# Altium project MD040EVM_RevA.PrjPCB (part 2 of 3)

## Sheet MD040_Motor_Driver_RevA.SchDoc
size 431 x 279 mm; Date: Not shown in title block; ApprovedBy: Not shown in title block; CheckedBy: Not shown in title block; Author: Not shown in title block; CompanyName: Not shown in title block; DrawnBy: ak; Engineer: Not shown in title block; Organization: Not shown in title block; Address1: Not shown in title block; Address2: Not shown in title block; Address3: Not shown in title block; Address4: Not shown in title block; DocumentNumber: 2; Revision: Use project parameter SCH_Rev; SheetNumber: 4; SheetTotal: 2; PageSetup: Record=PageOptions|CenterHorizontal=True|CenterVertical=True|PrintScale=1.00|XCorrection=1.00|YCorrection=1.00|PrintKind=0|BorderSize=5000000|LeftOffset=0|BottomOffset=0|Orientation=2|PaperLength=1000|PaperWidth=1000|Scale=100|PaperSource=15|PrintQuality=600|MediaType=1|DitherType=10|PaperKind=Letter|PrintScaleMode=1; CurrentTime: Not shown in title block; CurrentDate: Not shown in title block; Time: Not shown in title block; DocumentFullPathAndName: Not shown in title block; DocumentName: Not shown in title block; ModifiedDate: Not shown in title block; ImagePath: Not shown in title block
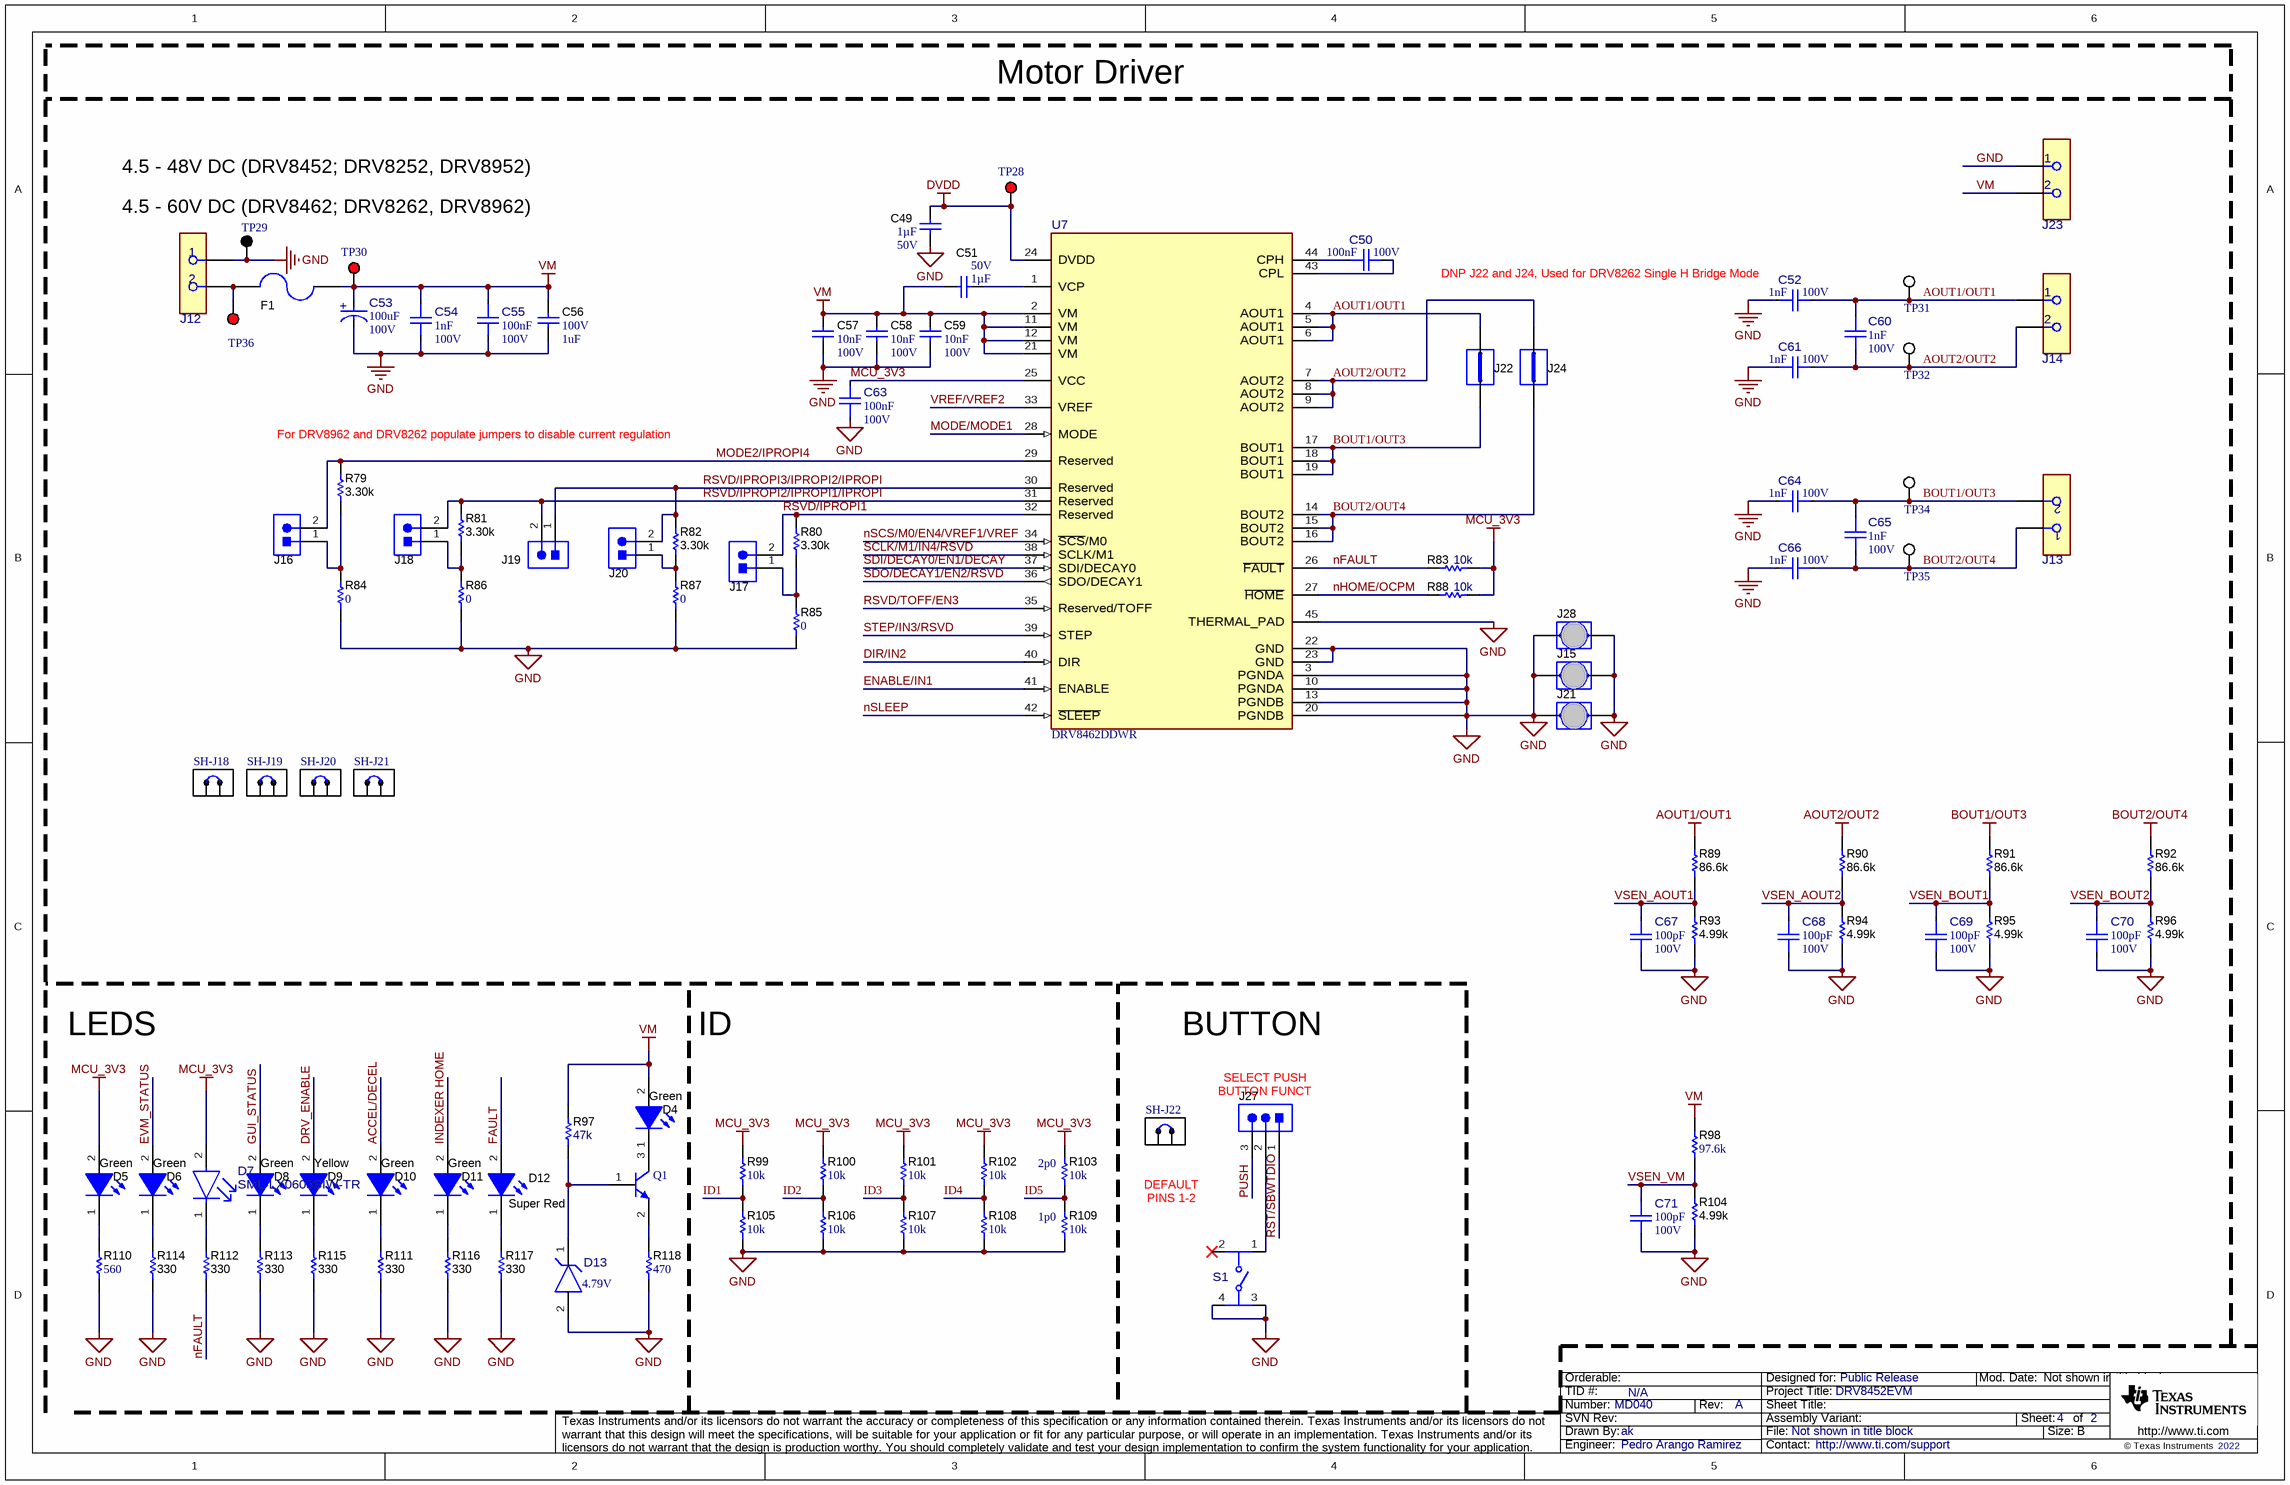
[diagram p1: MD040_Motor_Driver_RevA.SchDoc]

### Parts
C49  Cap_F: 1µF  VDC_V: 50V  [0805_HV]  (hidden comment: C2012X7R1H105K125AB)
C50  Cap_F: 100nF  VDC_V: 100V  [FP-885012206120_0603-MFG]  (hidden comment: 885012206120)
C51  Cap_F: 1µF  VDC_V: 50V  [0805_HV]  (hidden comment: C2012X7R1H105K125AB)
C52  ValueDisplayed: 1nF  VDC_V: 100V  [FP-885012006085_0603-MFG]  (hidden comment: 885012006085)
C53  ValueDisplayed: 100uF  VDC_V: 100V  [FP-EMVY101ARA101MKE0S_RADIAL-MFG]  (hidden comment: EMVY101ARA101MKE0S)
C54  ValueDisplayed: 1nF  VDC_V: 100V  [FP-885012006085_0603-MFG]  (hidden comment: 885012006085)
C55  Cap_F: 100nF  VDC_V: 100V  [FP-885012206120_0603-MFG]  (hidden comment: 885012206120)
C56  VDC_V: 100V  ValueDisplayed: 1uF  [1210_220]  (hidden comment: CGA6M2X7R2A105K200AA)
C57  Cap_F: 10nF  VDC_V: 100V  [0603L]  (hidden comment: 885012206114)
C58  Cap_F: 10nF  VDC_V: 100V  [0603L]  (hidden comment: 885012206114)
C59  Cap_F: 10nF  VDC_V: 100V  [0603L]  (hidden comment: 885012206114)
C60  ValueDisplayed: 1nF  VDC_V: 100V  [FP-885012006085_0603-MFG]  (hidden comment: 885012006085)
C61  ValueDisplayed: 1nF  VDC_V: 100V  [FP-885012006085_0603-MFG]  (hidden comment: 885012006085)
C63  Cap_F: 100nF  VDC_V: 100V  [FP-885012206120_0603-MFG]  (hidden comment: 885012206120)
C64  ValueDisplayed: 1nF  VDC_V: 100V  [FP-885012006085_0603-MFG]  (hidden comment: 885012006085)
C65  ValueDisplayed: 1nF  VDC_V: 100V  [FP-885012006085_0603-MFG]  (hidden comment: 885012006085)
C66  ValueDisplayed: 1nF  VDC_V: 100V  [FP-885012006085_0603-MFG]  (hidden comment: 885012006085)
C67  ValueDisplayed: 100pF  VDC_V: 100V  [FP-885012005080_0402-MFG]  (hidden comment: 885012005080)
C68  ValueDisplayed: 100pF  VDC_V: 100V  [FP-885012005080_0402-MFG]  (hidden comment: 885012005080)
C69  ValueDisplayed: 100pF  VDC_V: 100V  [FP-885012005080_0402-MFG]  (hidden comment: 885012005080)
C70  ValueDisplayed: 100pF  VDC_V: 100V  [FP-885012005080_0402-MFG]  (hidden comment: 885012005080)
C71  ValueDisplayed: 100pF  VDC_V: 100V  [FP-885012005080_0402-MFG]  (hidden comment: 885012005080)
D4  value Green  [WL-SMCW_GREEN]  (hidden comment: 150060VS75000)
D5  value Green  [WL-SMCW_GREEN]  (hidden comment: 150060VS75000)
D6  value Green  [WL-SMCW_GREEN]  (hidden comment: 150060VS75000)
D7  SML-LX0603SIW-TR  [FP-SML-LX0603SIW-TR_0603-MFG]
D8  value Green  [WL-SMCW_GREEN]  (hidden comment: 150060VS75000)
D9  value Yellow  [WL-SMCW_YELLOW]  (hidden comment: 150060YS75000)
D10  value Green  [WL-SMCW_GREEN]  (hidden comment: 150060VS75000)
D11  value Green  [WL-SMCW_GREEN]  (hidden comment: 150060VS75000)
D12  value Super Red  [WL-SMCW_RED]  (hidden comment: 150060SS75000)
D13  Vf_V: 4.79V  [FP-BZX84J-B4V7,115_SC90-MFG]  (hidden comment: BZX84J-B4V7,115)
F1  0463015.ER  [Fuse_0463]  (value not drawn)
J12  691256610002  [FP-691256610002_HDR2-MFG]  (value not drawn)
J13  691250610002  [FP-691250610002_CONN_TERM_BLOCK2-MFG]  (value not drawn)
J14  691250610002  [FP-691250610002_CONN_TERM_BLOCK2-MFG]  (value not drawn)
J15  D3082-05  [Harwin_D3082-05]  (value not drawn)
J16  PBC02SAAN  [Sullins_PBC02SAAN]  (value not drawn)
J17  PBC02SAAN  [Sullins_PBC02SAAN]  (value not drawn)
J18  PBC02SAAN  [Sullins_PBC02SAAN]  (value not drawn)
J19  PBC02SAAN  [Sullins_PBC02SAAN]  (value not drawn)
J20  PBC02SAAN  [Sullins_PBC02SAAN]  (value not drawn)
J21  D3082-05  [Harwin_D3082-05]  (value not drawn)
J22  D3082-05  [Harwin_D3082-05]  (value not drawn)
J23  691250610002  [FP-691250610002_CONN_TERM_BLOCK2-MFG]  (value not drawn)
J24  D3082-05  [Harwin_D3082-05]  (value not drawn)
J27  61300311121  [WURTH_61300311121]  (value not drawn)
J28  D3082-05  [Harwin_D3082-05]  (value not drawn)
Q1  BC846BLT1G  [ONSC-SOT-23-3-318-08_V]  (value not drawn)
R79  ValueDisplayed: 3.30k  [0402L]  (hidden comment: ERJ-2RKF3301X)
R80  ValueDisplayed: 3.30k  [0402L]  (hidden comment: ERJ-2RKF3301X)
R81  ValueDisplayed: 3.30k  [0402L]  (hidden comment: ERJ-2RKF3301X)
R82  ValueDisplayed: 3.30k  [0402L]  (hidden comment: ERJ-2RKF3301X)
R83  ValueDisplayed: 10k  [0603L]  (hidden comment: RC0603JR-0710KL)
R84  ValueDisplayed: 0  [0402]  (hidden comment: CRCW04020000Z0EDHP)
R85  ValueDisplayed: 0  [0402]  (hidden comment: CRCW04020000Z0EDHP)
R86  ValueDisplayed: 0  [0402]  (hidden comment: CRCW04020000Z0EDHP)
R87  ValueDisplayed: 0  [0402]  (hidden comment: CRCW04020000Z0EDHP)
R88  ValueDisplayed: 10k  [0603L]  (hidden comment: RC0603JR-0710KL)
R89  ValueDisplayed: 86.6k  [0603L]  (hidden comment: CRCW060386K6FKEA)
R90  ValueDisplayed: 86.6k  [0603L]  (hidden comment: CRCW060386K6FKEA)
R91  ValueDisplayed: 86.6k  [0603L]  (hidden comment: CRCW060386K6FKEA)
R92  ValueDisplayed: 86.6k  [0603L]  (hidden comment: CRCW060386K6FKEA)
R93  ValueDisplayed: 4.99k  [0603L]  (hidden comment: CRCW06034K99FKEA)
R94  ValueDisplayed: 4.99k  [0603L]  (hidden comment: CRCW06034K99FKEA)
R95  ValueDisplayed: 4.99k  [0603L]  (hidden comment: CRCW06034K99FKEA)
R96  ValueDisplayed: 4.99k  [0603L]  (hidden comment: CRCW06034K99FKEA)
R97  ValueDisplayed: 47k  [0402]  (hidden comment: CRCW040247K0JNED)
R98  ValueDisplayed: 97.6k  [0603]  (hidden comment: RT0603DRE0797K6L)
R99  ValueDisplayed: 10k  [0603L]  (hidden comment: RC0603JR-0710KL)
R100  ValueDisplayed: 10k  [0603L]  (hidden comment: RC0603JR-0710KL)
R101  ValueDisplayed: 10k  [0603L]  (hidden comment: RC0603JR-0710KL)
R102  ValueDisplayed: 10k  [0603L]  (hidden comment: RC0603JR-0710KL)
R103  ValueDisplayed: 10k  [0603L]  (hidden comment: RC0603JR-0710KL)
R104  ValueDisplayed: 4.99k  [0603L]  (hidden comment: CRCW06034K99FKEA)
R105  ValueDisplayed: 10k  [0603L]  (hidden comment: RC0603JR-0710KL)
R106  ValueDisplayed: 10k  [0603L]  (hidden comment: RC0603JR-0710KL)
R107  ValueDisplayed: 10k  [0603L]  (hidden comment: RC0603JR-0710KL)
R108  ValueDisplayed: 10k  [0603L]  (hidden comment: RC0603JR-0710KL)
R109  ValueDisplayed: 10k  [0603L]  (hidden comment: RC0603JR-0710KL)
R110  ValueDisplayed: 560  [0603]  (hidden comment: RC0603FR-07560RL)
R111  ValueDisplayed: 330  [0603L]  (hidden comment: CMP-0025785-4)
R112  ValueDisplayed: 330  [0603L]  (hidden comment: CMP-0025785-4)
R113  ValueDisplayed: 330  [0603L]  (hidden comment: CMP-0025785-4)
R114  ValueDisplayed: 330  [0603L]  (hidden comment: CMP-0025785-4)
R115  ValueDisplayed: 330  [0603L]  (hidden comment: CMP-0025785-4)
R116  ValueDisplayed: 330  [0603L]  (hidden comment: CMP-0025785-4)
R117  ValueDisplayed: 330  [0603L]  (hidden comment: CMP-0025785-4)
R118  ValueDisplayed: 470  [0603]  (hidden comment: RC0603FR-07470RL)
S1  430481025816  [FP-430481025816_SMT_SW_6MM2_6MM2-MFG]  (value not drawn)
SH-J18  60900213421  [Wurth_60900213421]  (value not drawn)
SH-J19  60900213421  [Wurth_60900213421]  (value not drawn)
SH-J20  60900213421  [Wurth_60900213421]  (value not drawn)
SH-J21  60900213421  [Wurth_60900213421]  (value not drawn)
SH-J22  60900213421  [Wurth_60900213421]  (value not drawn)
TP28  5010  [Keystone5010]  (value not drawn)
TP29  5011  [Keystone5011]  (value not drawn)
TP30  5010  [Keystone5010]  (value not drawn)
TP31  5015  [Testpoint_Keystone_Miniature]  (value not drawn)
TP32  5015  [Testpoint_Keystone_Miniature]  (value not drawn)
TP34  5015  [Testpoint_Keystone_Miniature]  (value not drawn)
TP35  5015  [Testpoint_Keystone_Miniature]  (value not drawn)
TP36  5010  [Keystone5010]  (value not drawn)
U7  DRV8462DDWR  [DDW0044E-MFG]

### Nets
AOUT1/OUT1: C52.2 C60.1 J14.1 J22.2 R89.2 TP31.1 U7.4(AOUT1) U7.5(AOUT1) U7.6(AOUT1)
AOUT2/OUT2: C60.2 C61.2 J14.2 J24.2 R90.2 TP32.1 U7.7(AOUT2) U7.8(AOUT2) U7.9(AOUT2)
BOUT1/OUT3: C64.2 C65.1 J13.2 J22.1 R91.2 TP34.1 U7.17(BOUT1) U7.18(BOUT1) U7.19(BOUT1)
BOUT2/OUT4: C65.2 C66.2 J13.1 J24.1 R92.2 TP35.1 U7.14(BOUT2) U7.15(BOUT2) U7.16(BOUT2)
DVDD: C49.1 TP28.1 U7.24(DVDD)
GND: C49.2 C52.1 C53.1(CATHODE) C54.2 C55.2 C56.2 C57.2 C58.2 C59.2 C61.1 C63.1 C64.1 C66.1 C67.2 C68.2 C69.2 C70.2 C71.2 D13.2(anode) J12.1 J15.1 J15.2 J21.1 J21.2 J23.1 J28.1 J28.2 R84.1 R85.1 R86.1 R87.1 R93.1 R94.1 R95.1 R96.1 R104.1 R105.2 R106.2 R107.2 R108.2 R109.2 R110.1 R111.1 R113.1 R114.1 R115.1 R116.1 R117.1 R118.1 S1.3 S1.4 TP29.1 U7.3(PGNDA) U7.10(PGNDA) U7.13(PGNDB) U7.20(PGNDB) U7.22(GND) U7.23(GND) U7.45(THERMAL_PAD)
MCU_3V3: C63.2 D5.2(A) D7.2(ANODE) R83.2 R88.2 R99.1 R100.1 R101.1 R102.1 R103.1 U7.25(VCC)
VM: C51.1 C53.2(ANODE) C54.1 C55.1 C56.1 C57.1 C58.1 C59.1 D4.2(A) F1.1 J23.2 R97.2 R98.2 TP30.1 U7.2(VM) U7.11(VM) U7.12(VM) U7.21(VM)
ACCEL/DECEL: D10.2(A)
DIR/IN2: U7.40(DIR)
DRV_ENABLE: D9.2(A)
ENABLE/IN1: U7.41(ENABLE)
EVM_STATUS: D6.2(A)
FAULT: D12.2(A)
GUI_STATUS: D8.2(A)
ID1: R99.2 R105.1
ID2: R100.2 R106.1
ID3: R101.2 R107.1
ID4: R102.2 R108.1
ID5: R103.2 R109.1
INDEXER HOME: D11.2(A)
MODE2/IPROPI4: J16.2 R79.2 U7.29(Reserved)
MODE/MODE1: U7.28(MODE)
nFAULT: R83.1 R112.1 U7.26(~{FAULT})
nHOME/OCPM: R88.1 U7.27(~{HOME})
nSCS/M0/EN4/VREF1/VREF: U7.34(~{SCS}/M0)
nSLEEP: U7.42(~{SLEEP})
PUSH: J27.3
RST/SBWTDIO: J27.1
RSVD/IPROPI1: J17.2 R80.2 U7.32(Reserved)
RSVD/IPROPI2/IPROPI1/IPROPI: J18.2 J19.2 R81.2 U7.31(Reserved)
RSVD/IPROPI3/IPROPI2/IPROPI: J19.1 J20.2 R82.2 U7.30(Reserved)
RSVD/TOFF/EN3: U7.35(Reserved/TOFF)
SCLK/M1/IN4/RSVD: U7.38(SCLK/M1)
SDI/DECAY0/EN1/DECAY: U7.37(SDI/DECAY0)
SDO/DECAY1/EN2/RSVD: U7.36(SDO/DECAY1)
STEP/IN3/RSVD: U7.39(STEP)
VREF/VREF2: U7.33(VREF)
VSEN_AOUT1: C67.1 R89.1 R93.2
VSEN_AOUT2: C68.1 R90.1 R94.2
VSEN_BOUT1: C69.1 R91.1 R95.2
VSEN_BOUT2: C70.1 R92.1 R96.2
VSEN_VM: C71.1 R98.1 R104.2
NetC50_1: C50.1 U7.44(CPH)
NetC50_2: C50.2 U7.43(CPL)
NetC51_2: C51.2 U7.1(VCP)
NetD5_1: D5.1(K) R110.2
NetD6_1: D6.1(K) R114.2
NetD7_1: D7.1(CATHODE) R112.2
NetD8_1: D8.1(K) R113.2
NetD9_1: D9.1(K) R115.2
NetD10_1: D10.1(K) R111.2
NetD11_1: D11.1(K) R116.2
NetD12_1: D12.1(K) R117.2
NetD13_1: D13.1(cathode) Q1.1(B) R97.1
NetF1_2: F1.2 J12.2 TP36.1
NetJ16_1: J16.1 R79.1 R84.2
NetJ17_1: J17.1 R80.1 R85.2
NetJ18_1: J18.1 R81.1 R86.2
NetJ20_1: J20.1 R82.1 R87.2
NetJ27_2: J27.2 S1.1
NetQ1_2: Q1.2(E) R118.2

Not connected (* = marked no-connect by the designer): D4 1(K); Q1 3(C); S1 2*

### Notes on the sheet
- Motor Driver
- 4.5 - 48V DC (DRV8452; DRV8252, DRV8952)
- 4.5 - 60V DC (DRV8462; DRV8262, DRV8962)
- (near C52) DNP J22 and J24, Used for DRV8262 Single H Bridge Mode
- (near R79) For DRV8962 and DRV8262 populate jumpers to disable current regulation
- LEDS
- ID
- BUTTON
- (near J27) SELECT PUSH
- (near J27) BUTTON FUNCT
- (near R103) 2p0
- (near R109) 1p0
- (near SH-J22) DEFAULT
- PINS 1-2
- Drawn By:
- SVN Rev:
- Number:
- TID #:
- Orderable:
- Rev:
- Sheet Title:
- File:
- Project Title:
- Designed for:
- Assembly Variant:
- Mod. Date:
- Sheet:
- Size:
- of
- B
- http://www.ti.com
- Texas Instruments and/or its licensors do not warrant the accuracy or completeness of this specification or any information contained therein. Texas Instruments and/or its licensors do not warrant that this design will meet the specifications, will be suitable for your application or fit for any particular purpose, or will operate in an implementation. Texas Instruments and/or its licensors do not warrant that the design is production worthy. You should completely validate and test your design implementation to confirm the system functionality for your application.
- Engineer:
- Contact:
- © Texas Instruments
- (in symbol CMP-0094051-1) +

### Library data of the parts
C49 C51 = CMP-0007873-2: CAP, CERM, 1 uF, 50 V, +/- 10%, X7R, 0805; Manufacturer: TDK; TaMin_C: -55°C; ESR_ohm: 8.782m; Polarized: N; SizeAreaWB_mm2: 6.75; Value1: 0.008782 ohm; U/M: EA; Value: 1uF; TaMax_C: 125°C; SizeZ_mm: 1.45; SizeX_mm: 2; SizeY_mm: 1.25; Cap_Case: 0805; SizeArea_mm2: 2.5; IRMS_A: 2.2049A; AEC Category: Q200; Supplier Part Number 2: 810-C2012X7R1H105K; Publisher: Texas Instruments; Supplier 2: Mouser; TempCo: X7R; Published: 2008-06-19; RoHS: Y; MountType: SMT; Supplier 1: Digi-Key; PackageReference: 0805; Tolerance_%: 10%; Value2: 50V; CompType: Capacitor; LatestRevisionDate: 2017-03-09; PartNumber: C2012X7R1H105K125AB; AEC Qualified: N; ComponentLink1Description: Datasheet link; AEC Grade: N/A; Supplier Part Number 1: 445-7547-1-ND; Technology: Ceramic; ValueDisplayed: 1uF; ComponentLink1URL: https://product.tdk.com/en/search/capacitor/ceramic/mlcc/info?part_no=C2012X7R1H105K125AB
C50 C55 C63 = CMP-0095152-1: 0.1 µF ±10% 100V Ceramic Capacitor X7R 0603 (1608 Metric); Manufacturer: Wurth Electronics; Value: 100nF; SizeZ_mm: 0.87mm; AEC Qualified: No; TempCo: 15%; Supplier 1: Digikey; Mouser Part Number: 710-885012206120; PartNumber: 885012206120; ValueDisplayed: 100nF; ComponentLink1Description: Datasheet; Digikey Part Number: 732-885012206120TR-ND; Supplier 2: Mouser; PackageReference: 0603; Datasheet Path: datasheets/Cap-885012206120.pdf; ComponentLink1URL: https://www.we-online.com/catalog/datasheet/885012206120.pdf; Supplier Part Number 2: 710-885012206120; Supplier Part Number 1: 732-885012206120TR-ND; Part Number: 885012206120; Tolerance_%: 10%; helpURL: https://upverter.com/upn/revision/38ac6779d2d2789e/; Lead Free: Yes; RoHS: TRUE; Temperature Characteristic: X7R; datasheet: https://www.we-online.com/catalog/datasheet/885012206120.pdf; Digikey Description: WCAP-CSGP GENERAL PURPOSE MLCC X; Operating Temperature Range: -55°C to +125°C
C52 C54 C60 C61 C64-C66 = CMP-0097311-1: 1000 pF ±5% 100V Ceramic Capacitor C0G, NP0 0603 (1608 Metric); Manufacturer: Wurth Electronics; TempCo: 30ppm/°C; SizeZ_mm: 0.87mm; AEC Qualified: No; Value: 1nF; ComponentLink1URL: https://www.we-online.com/katalog/datasheet/885012006085.pdf; Temperature Characteristic: NP0; RoHS: TRUE; Part Number: 885012006085; Cap_F: 1nF; Mouser Description: Cap, 1000PF, 100V, 5%, C0G/NP0, 0603; Digikey Part Number: 732-12187-1-ND; Datasheet Path: datasheets/Cap-885012006085.pdf; Digikey Description: CAP CER 1000PF 100V C0G/NP0 0603; PackageReference: 0603; Mouser Part Number: 710-885012006085; Supplier Part Number 2: 710-885012006085; PartNumber: 885012006085; Supplier 1: Digikey; Lead Free: Yes; datasheet: https://www.we-online.com/katalog/datasheet/885012006085.pdf; Supplier 2: Mouser; helpURL: https://upverter.com/upn/revision/edb0b292dcaf6ba6/; Operating Temperature Range: -55°C to +125°C; ComponentLink1Description: Datasheet; Tolerance_%: 5%; Supplier Part Number 1: 732-12187-1-ND
C53 = CMP-0094051-1: 100uF 100V 20% Aluminum Electrolytic Capacitors Radial, Can - SMD - 5000 Hrs @ 105°C; Manufacturer: United Chemi-Con; Value: 100µF; IRMS_A: 450mA; Life: 5000Hours; SizeZ_mm: 14mm; AEC Grade: Grade 2; Leakage Current: 100uA; Dissipation Factor: 10%; AEC Qualified: Yes; Tolerance_%: 20%; Supplier 1: Digikey; helpURL: https://upverter.com/upn/revision/452647827c621875/; Lead Free: Yes; Part Number: EMVY101ARA101MKE0S; Supplier Part Number 1: 565-2511-1-ND; PartNumber: EMVY101ARA101MKE0S; Cap_F: 100µF; ComponentLink1Description: Datasheet; Digikey Part Number: 565-2511-1-ND; Datasheet Path: datasheets/Cap-EMVY101ARA101MKE0S.pdf; RoHS: TRUE; Mouser Description: Cap Aluminum Lytic 100uF 100V 20% (12.5 X 13.5mm) SMD 450mA 5000h 105C Automotive T/R; ComponentLink1URL: https://www.chemi-con.co.jp/products/relatedfiles/capacitor/catalog/MVYRA-e.PDF; Operating Temperature Range: -40°C to +105°C; PackageReference: RADIAL; datasheet: https://www.chemi-con.co.jp/products/relatedfiles/capacitor/catalog/MVYRA-e.PDF; Digikey Description: CAP ALUM 100UF 20% 100V SMD; Mouser Part Number: 661-EMVY101ARA101MKE; Supplier Part Number 2: 661-EMVY101ARA101MKE; Supplier 2: Mouser
C56 = CMP-0009145-2: CAP, CERM, 1 uF, 100 V, +/- 10%, X7R, AEC-Q200 Grade 1, 1210; Manufacturer: TDK; TaMin_C: -55°C; ESR_ohm: 4.956m; Polarized: N; SizeAreaWB_mm2: 14.7; Value1: 0.004956 ohm; U/M: EA; Value: 1uF; TaMax_C: 125°C; SizeZ_mm: 2.2; SizeX_mm: 3.2; SizeY_mm: 2.5; SizeArea_mm2: 8; AEC Qualified: Y; Cap_F: 1µF; IRMS_A: 3.30731A; AEC Grade: 1; AEC Category: Q200; Supplier Part Number 2: 810-CGA6M2X7R2A105K200AA; Publisher: Texas Instruments; Supplier 2: Mouser; TempCo: X7R; Published: 2008-06-19; RoHS: Y; MountType: SMT; Supplier 1: Digi-Key; PackageReference: 1210; Tolerance_%: 10%; Cap_Case: 1210_220; Value2: 100V; CompType: Capacitor; LatestRevisionDate: 2017-03-09; PartNumber: CGA6M2X7R2A105K200AA; ComponentLink1Description: Datasheet link; Supplier Part Number 1: 445-5865-1-ND; Technology: Ceramic; ComponentLink1URL: https://product.tdk.com/en/search/capacitor/ceramic/mlcc/info?part_no=CGA6M2X7R2A105K200AA
C57-C59 = CMP-0079993-1: CAP, CERM, 0.01 µF, 100 V,+/- 10%, X7R, 0603; Manufacturer: Wurth Elektronik; Polarized: N; Value: 0.01uF; ValueDisplayed: 0.01µF; U/M: EA; TaMin_C: -55°C; TaMax_C: 105°C; Cap_Case: 0603; SizeX_mm: 1.6; SizeArea_mm2: 1.28; AEC Category: Q200; SizeZ_mm: 1; SizeAreaWB_mm2: 4.68; SizeY_mm: 0.8; CompType: Capacitor; PartNumber: 885012206114; PackageReference: 0603; RoHS: Y; Tolerance_%: 10%; Value2: 100V; MountType: SMT; Technology: Ceramic; TempCo: X7R; ComponentLink1Description: Datasheet link; ComponentLink1URL: http://katalog.we-online.de/pbs/datasheet/885012206114.pdf; Supplier 1: Newark; Supplier Part Number 1: 45AC8565; Supplier 2: Farnell; Supplier Part Number 2: 2812368; AEC Qualified: N; AEC Grade: N/A
C67-C71 = CMP-0097308-1: 100 pF ±5% 100V Ceramic Capacitor C0G, NP0 0402 (1005 Metric); Manufacturer: Wurth Electronics; Value: 100pF; SizeZ_mm: 0.55mm; TempCo: 30ppm/°C; AEC Qualified: No; Digikey Part Number: 732-12055-1-ND; Mouser Part Number: 710-885012005080; datasheet: https://www.we-online.com/catalog/datasheet/885012005080.pdf; Supplier 2: Mouser; Cap_F: 100pF; Mouser Description: Cap, 100PF, 100V, 5%, C0G/NP0, 0402; Datasheet Path: datasheets/Cap-885012005080.pdf; Supplier 1: Digikey; helpURL: https://upverter.com/upn/revision/ec0fd02776fae1b6/; Lead Free: Yes; PackageReference: 0402; RoHS: TRUE; Tolerance_%: 5%; Temperature Characteristic: NP0; Supplier Part Number 2: 710-885012005080; PartNumber: 885012005080; ComponentLink1URL: https://www.we-online.com/catalog/datasheet/885012005080.pdf; Part Number: 885012005080; Supplier Part Number 1: 732-12055-1-ND; Digikey Description: CAP CER 100PF 100V C0G/NP0 0402; ComponentLink1Description: Datasheet; Operating Temperature Range: -55°C to +125°C
D4-D6 D8 D10 D11 = CMP-0002894-2: LED, Green, SMD; Manufacturer: Wurth Elektronik; Type: AlInGaP; Value2: 2V; Io_A: 20mA; Value1: W; PartNumber: 150060VS75000; PackageReference: LED_0603; ComponentLink1Description: Datasheet link; ComponentLink1URL: http://katalog.we-online.de/led/datasheet/150060VS75000.pdf; Color: green; RoHS: Y; MountType: SMT; CompType: LED; Vf_V: 2V
D7 = CMP-0092971-1: Red - LED Indication - Discrete 2V 0603 (1608 Metric) 2V @ 20mA 71.5mcd 48mW; Manufacturer: Lumex; Led Orientation: Top View; Vr_V: 5V; LambdaP: 632nm; AEC Qualified: No; Angle: 128°; SizeZ_mm: 0.727mm; Digikey Description: LED RED DIFFUSED SMD; ComponentLink1Description: Datasheet; Vf_V: 2V; ComponentLink1URL: https://www.lumex.com/datasheet/SML-LX0603SIW-TR; Operating Temperature Range: -40°C to +85°C; PackageReference: 0603; helpURL: https://upverter.com/upn/revision/94e7ffcf0c58ff44/; Power_TotalModule: 48mW; RoHS: TRUE; Mouser Part Number: 696-SML-LX0603SIW; Lead Free: Yes; Luminous Intensity: 71.5mcd; Forward Current: 20mA; datasheet: https://www.lumex.com/datasheet/SML-LX0603SIW-TR; Color: Red; PartNumber: SML-LX0603SIW-TR; Datasheet Path: datasheets/Diode-SML-LX0603SIW-TR.pdf; Mouser Description: Standard LEDs - SMD Hi-Int Red, 636nm 2V, 60mcd; Part Number: SML-LX0603SIW-TR; Digikey Part Number: 67-1690-1-ND
D9 = CMP-0002892-3: LED, Yellow, SMD; Manufacturer: Wurth Elektronik; Value1: W; Vf_V: 2V; Type: AlInGaP; Io_A: 20mA; PartNumber: 150060YS75000; PackageReference: LED_0603; ComponentLink1Description: Datasheet link; ComponentLink1URL: http://katalog.we-online.de/led/datasheet/150060YS75000.pdf; Color: yellow; MountType: SMT; Value2: 2V; CompType: LED; RoHS: Y
D12 = CMP-0002893-1: LED, Super Red, SMD; Manufacturer: Wurth Elektronik; Io_A: 20mA; Value1: W; U/M: EA; Vf_V: 1.9V; Type: AlInGaP; ComponentLink1URL: http://katalog.we-online.de/led/datasheet/150060SS75000.pdf; Supplier Part Number 2: 95W3796; Publisher: Texas Instruments; Supplier 2: Newark; Supplier Part Number 3: 2322072; Color: super red; Supplier 3: Farnell; Published: 2008-07-11; RoHS: Y; MountType: SMT; Supplier 1: Digi-Key; PackageReference: LED_0603; Value2: 1.9V; CompType: LED; LatestRevisionDate: 2017-03-09; PartNumber: 150060SS75000; ComponentLink1Description: Datasheet link; Supplier Part Number 1: 732-4979-1-ND
D13 = CMP-0097377-1: Diode Zener Single 4.7V 2% 550mW Automotive 2-Pin SOD-323F T/R; Manufacturer: Nexperia; TaMin_C: -55°C; Vr_V: 2V; SizeZ_mm: 0.8mm; Max Reverse Leakage Current: 3uA; TJmax_C: 150°C; Zener Impedance: 80Ω; AEC Grade: Grade 0; Forward Current: 250mA; TaMax_C: +150°C; AEC Qualified: Yes; helpURL: https://upverter.com/upn/revision/e38fd3c12c5fddfe/; RoHS: TRUE; Lead Free: Yes; Vz_V: 4.7V; PackageReference: SC90; ComponentLink1URL: https://assets.nexperia.com/documents/data-sheet/BZX84J_SER.pdf; ComponentLink1Description: Datasheet; Digikey Description: DIODE ZENER 4.7V 550MW SOD323F; Operating Temperature Range: to +150°C; Power_W: 550mW; datasheet: https://assets.nexperia.com/documents/data-sheet/BZX84J_SER.pdf; Mouser Part Number: 771-BZX84J-B4V7,115; PartNumber: BZX84J-B4V7,115; Part Number: BZX84J-B4V7,115; Digikey Part Number: 1727-1672-1-ND; Datasheet Path: datasheets/Diode-BZX84J-B4V7,115.pdf
F1 = CMP-0081016-1: Fuse, 15 A, 250 VAC, 100 VDC, SMD; Manufacturer: Littelfuse; TaMin_C: -55°C; Irating_A: 15A; SizeAreaWB_mm2: 61.952; Interrupt_AC: 100A; Interrupt_DC: 50A; VAC_V: 250V; TaMax_C: 125°C; Fuse Speed: Fast; SizeZ_mm: 3.12; SizeX_mm: 10.1; SizeArea_mm2: 31.512; VDC_V: 100V; Fuse Technology: Board Mount; Rtyp_Ohm: 4.7m; MeltingTyp: 142; ComponentLink1URL: http://www.littelfuse.com/~/media/electronics/datasheets/fuses/littelfuse_fuse_463_datasheet.pdf.pdf; RoHS: Y; MountType: SMT; PackageReference: 10.1x3.12mm; SizeY_mm: 3.12; CompType: Fuse; PartNumber: 0463015.ER; ComponentLink1Description: Datasheet URL
J12 = CMP-0086764-1: 2 Position Wire to Board Terminal Block Horizontal with Board 0.400" (10.16mm) Through Hole.  58A max.; Manufacturer: Wurth; Current_A: 57A; Voltage_V: 750V; ContactFinish: Zinc; Row_Count: 1; PackageReference: HDR2; PinCount: 2; ComponentLink1Description: Datasheet; PartNumber: 691256610002; RoHS: TRUE; Symbol Name: SYM-691256610002; ComponentLink1URL: https://katalog.we-online.de/em/datasheet/691256610002.pdf
J13 J14 J23 = CMP-0093233-2: 2 Position Wire to Board Terminal Block Horizontal with Board 0.250" (6.35mm) Through Hole; Manufacturer: Wurth Electronics; Current_A: 32A; Conn Gender: Female; Row_Count: 1; ContactFinish: Zinc; SizeZ_mm: 21.6mm; Max Wire Gauge: 10; Min Wire Gauge: 30; Voltage_V: 450V; AEC Qualified: No; Is Female: yes; ComponentLink1Description: Datasheet; Supplier Part Number 1: 732-691250610002-ND; PartNumber: 691250610002; Mouser Part Number: 710-691250610002; Digikey Description: 6.35 MM TERMINAL BLOCK, HORIZONT; Conn Orientation: Horizontal; datasheet: https://www.we-online.com/catalog/datasheet/691250610002.pdf; Operating Temperature Range: -32°C to +120°C; Supplier 2: Mouser; Part Number: 691250610002; DUT-Pitch_mm: 6.35mm; helpURL: https://upverter.com/upn/revision/d28b3e63272a3f4f/; ComponentLink1URL: https://www.we-online.com/catalog/datasheet/691250610002.pdf; Supplier Part Number 2: 710-691250610002; Lead Free: Yes; Datasheet Path: datasheets/Conn-691250610002.pdf; Supplier 1: Digikey; RoHS: TRUE; PinCount: 2; PackageReference: CONN_TERM_BLOCK2; Digikey Part Number: 732-691250610002-ND
J15 J21 J22 J24 J28 = CMP-0075110-1: 1mm Uninsulated Shorting Plug, 10.16mm spacing, TH; Manufacturer: Harwin; CNHeader: False; Green_Lifecycle: Active; Green_REACh: Passed; CompType: Jumper Wire; ComponentLink1URL: http://cdn.harwin.com/pdfs/D3080-D3083.pdf; Supplier Part Number 2: 01E9240; Publisher: Texas Instruments; Supplier 2: Newark; Supplier Part Number 3: 855-D3082-05; Supplier 3: Mouser; RoHS: Y; MountType: TH; Green_EU RoHS-2: Passed; Supplier 1: Digi-Key; Green_EU RoHS: Passed with Exemption; PackageReference: Shorting Plug, 10.16mm spacing, TH; LatestRevisionDate: 2017-07-12; PartNumber: D3082-05; ComponentLink1Description: Datasheet URL; Supplier Part Number 1: 952-1873-ND; CT: False
J16-J20 = CMP-0054566-1: Header, 100mil, 2x1, Gold, TH; Manufacturer: Sullins Connector Solutions; CNHeader: TRUE; Current_A: 3A; Green_Lifecycle: Active; Shrouded: N; Gender: Male; Green_REACh: Passed; Voltage_V: 1.8kV; Row_Count: 1; Pitch_mm: 2.54; CT: FALSE; Cert_UL: Y; ComponentLink1URL: http://www.sullinscorp.com/catalogs/77_PAGE108-109_.100_MALE_HDR.pdf; ClassName: Header; Publisher: Texas Instruments; Color: Black; RoHS: Y; MountType: TH; Green_EU RoHS-2: Passed; Supplier 1: Digi-Key; Green_EU RoHS: Passed; PackageReference: Sullins 100mil, 1x2, 230 mil above insulator; PinCount: 2; CompType: Header; LatestRevisionDate: 26/05/2017; PartNumber: PBC02SAAN; Orientation: Vertical; ComponentLink1Description: Datasheet URL; Supplier Part Number 1: S1011E-02-ND; ContactFinish: Gold
J27 = CMP-0054796-4: Header, 2.54 mm, 3x1, Gold, TH; Manufacturer: Wurth Elektronics; Green_Lifecycle: Active; Green_REACh: Passed; CT: FALSE; CNHeader: TRUE; MountType: TH; Supplier Part Number 1: 732-5316-ND; ClassName: Header; Supplier Part Number 3: 356154; ComponentLink1Description: Datasheet URL; ComponentLink1URL: http://katalog.we-online.de/em/datasheet/6130xx11121.pdf; PackageReference: Header, 2.54mm, 3x1, TH; Supplier Part Number 2: 20X0950; Green_EU RoHS-2: Incomplete; CompType: Header; Green_EU RoHS: Passed; RoHS: Y; PartNumber: 61300311121; Supplier 2: Newark; Supplier 1: Digi-Key; Supplier 3: Farnell; Publisher: Texas Instruments; LatestRevisionDate: 26/05/2017
Q1 = CMP-1048-00779-1: General Purpose Transistor, NPN Silicon, 3-Pin SOT-23, Pb-Free, Tape and Reel; Manufacturer: On Semiconductor; fT Min (MHz): 100; IC Continuous (A): 0.1; Mounting Technology: Surface Mount; ComponentLink1Description: Manufacturer URL; ComponentLink2Description: Datasheet; Polarity: NPN; ComponentLink3URL: http://www.onsemi.cn/pub_link/Collateral/318-08.PDF; DatasheetVersion: Rev. 11; ComponentLink3Description: Package Specification; PartNumber: BC846BLT1G; RoHS: TRUE; PackageDescription: 3-Pin Small Outline Transistor, Body 2.92 x 1.3 mm, Pitch 0.95 mm; PackageReference: SOT-23-3-318-08; ComponentLink2URL: http://www.onsemi.cn/pub_link/Collateral/BC846ALT1-D.PDF; PackageVersion: Rev. AP, 11/2009; ComponentLink1URL: http://www.onsemi.com/; Packing: Tape and Reel
R79-R82 = CMP-0026695-1: RES, 3.30 k, 1%, 0.1 W, AEC-Q200 Grade 0, 0402; Manufacturer: Panasonic; Power_W: 100mW; TempCo: 100 ppm/C; Value_Code: 3k30; U/M: EA; Value: 3.30k; Res_ohm: 3.3k; SizeX_mm: 1; SizeY_mm: 0.5; SizeZ_mm: 0.6; Value2: 0.1W; AEC Qualified: Y; VDC_V: 50V; AEC Grade: 0; AEC Category: Q200; ComponentLink1URL: http://industrial.panasonic.com/cdbs/www-data/pdf/RDA0000/AOA0000C86.pdf; Supplier Part Number 2: 64R5278; Publisher: Texas Instruments; Supplier 2: Newark; Supplier Part Number 3: 667-ERJ-2RKF3301X; Supplier 3: Mouser; Published: 2008-06-26; RoHS: Y; Value1: 1%; MountType: SMT; Supplier 1: Digi-Key; PackageReference: 0402; Tolerance_%: 1%; SizeArea_mm2: 0.5; CompType: Resistor; LatestRevisionDate: 2017-03-09; PartNumber: ERJ-2RKF3301X; ComponentLink1Description: Datasheet link; Supplier Part Number 1: P3.30KLCT-ND; Technology: Thick Film
R83 R88 = CMP-0025886-3: RES, 10 k, 5%, 0.1 W, 0603; Manufacturer: Yageo America; Power_W: 100mW; TempCo: 100 ppm/C; Value_Code: 10k0; U/M: EA; Value: 10k; EIA_Code: E24; SizeX_mm: 1.6; SizeY_mm: 0.8; SizeZ_mm: 1; Value2: 0.1W; SizeArea_mm2: 1.28; VDC_V: 50V; AEC Category: Q200; Supplier Part Number 2: 603-RC0603JR-0710KL; Publisher: Texas Instruments; Supplier 2: Mouser; Supplier Part Number 3: 9233504; Supplier 3: Farnell; Published: 2008-06-26; RoHS: Y; Value1: 5%; MountType: SMT; Supplier 1: Digi-Key; PackageReference: 0603; Tolerance_%: 5%; Res_ohm: 10k; CompType: Resistor; LatestRevisionDate: 2017-03-09; PartNumber: RC0603JR-0710KL; AEC Qualified: ?; ComponentLink1Description: Datasheet link; Supplier Part Number 1: 311-10KGRCT-ND; Technology: Thick Film; ComponentLink1URL: http://www.yageo.com/pdf/Pu-RC0603_51_PbFree_L_2.pdf
R84-R87 = CMP-0081856-1: RES, 0, 0%, 0.2 W, AEC-Q200 Grade 0, 0402; Manufacturer: Vishay-Dale; SizeAreaWB_mm2: 3; SizeArea_mm2: 0.5; AEC Qualified: Y; AEC Category: Q200; Value: 0; SizeZ_mm: 0.6; Power_W: 200mW; VDC_V: 50V; Value2: 0.2W; SizeX_mm: 1; ComponentLink1Description: Datasheet link; RoHS: Y; Supplier Part Number 3: 71-CRCW04020000Z0EDH; Tolerance_%: 0%; Value_Code: 0; Supplier 1: Digi-Key; PackageReference: 0402; Technology: Thick Film; Res_ohm: 0; PartNumber: CRCW04020000Z0EDHP; Supplier Part Number 2: 96Y9050; Supplier 2: Newark; AEC Grade: 0; SizeY_mm: 0.5; ComponentLink1URL: http://www.vishay.com/docs/20043/crcwhpe3.pdf; Value1: 0%; CompType: Resistor; MountType: SMT; Supplier Part Number 1: 541-0.0YBTR-ND; Supplier 3: Mouser
R89-R92 = CMP-0022628-3: RES, 86.6 k, 1%, 0.1 W, 0603; Manufacturer: Vishay-Dale; Value: 86.6k; Value_Code: 86k6; Power_W: 100mW; Value2: 0.1W; VDC_V: 75V; TempCo: 100 ppm/C; EIA_Code: E96; U/M: EA; AEC Category: Q200; SizeY_mm: 0.8; SizeZ_mm: 1; SizeArea_mm2: 1.28; SizeX_mm: 1.6; CompType: Resistor; PartNumber: CRCW060386K6FKEA; PackageReference: 0603; RoHS: Y; Res_ohm: 86.6k; Tolerance_%: 1%; Value1: 1%; MountType: SMT; Technology: Thick Film; Published: 2008-06-26; Publisher: Texas Instruments; LatestRevisionDate: 2017-03-09; ComponentLink1Description: Datasheet link; ComponentLink1URL: http://www.vishay.com/docs/20035/dcrcwe3.pdf; Supplier 1: Digi-Key; Supplier Part Number 1: 541-86.6KHCT-ND; Supplier 2: Newark; Supplier Part Number 2: 52K8751; Supplier 3: Mouser; Supplier Part Number 3: 71-CRCW0603-86.6K-E3; AEC Qualified: ?
R93-R96 R104 = CMP-0022458-4: RES, 4.99 k, 1%, 0.1 W, AEC-Q200 Grade 0, 0603; Manufacturer: Vishay-Dale; Value: 4.99k; Value_Code: 4k99; Power_W: 100mW; Value2: 0.1W; VDC_V: 75V; TempCo: 100 ppm/C; EIA_Code: E96; SizeX_mm: 1.6; SizeY_mm: 0.8; SizeZ_mm: 1; SizeArea_mm2: 1.28; AEC Qualified: Y; AEC Category: Q200; AEC Grade: 0; CompType: Resistor; PartNumber: CRCW06034K99FKEA; PackageReference: 0603; RoHS: E; Res_ohm: 4.99k; Tolerance_%: 1%; Value1: 1%; MountType: SMT; Technology: Thick Film; ComponentLink1Description: Datasheet link; ComponentLink1URL: http://www.vishay.com/docs/20035/dcrcwe3.pdf; Supplier 1: Digi-Key; Supplier Part Number 1: 541-4.99KHCT-ND; Supplier 2: Newark; Supplier Part Number 2: 52K8500; Supplier 3: Mouser; Supplier Part Number 3: 71-CRCW0603-4.99K-E3
R97 = CMP-0026935-3: RES, 47 k, 5%, 0.063 W, AEC-Q200 Grade 0, 0402; Manufacturer: Vishay-Dale; Power_W: 63mW; TempCo: 200 ppm/C; Value_Code: 47k0; Value: 47k; EIA_Code: E24; SizeX_mm: 1; SizeY_mm: 0.5; SizeZ_mm: 0.6; Value2: 0.063W; AEC Qualified: Y; VDC_V: 50V; AEC Category: Q200; AEC Grade: 0; Supplier Part Number 2: 52K7099; Supplier 2: Newark; Supplier Part Number 3: 71-CRCW0402-J-47K-E3; Supplier 3: Mouser; RoHS: E; Value1: 5%; MountType: SMT; Supplier 1: Digi-Key; PackageReference: 0402; Tolerance_%: 5%; Res_ohm: 47k; SizeArea_mm2: 0.5; CompType: Resistor; PartNumber: CRCW040247K0JNED; ComponentLink1Description: Datasheet link; Supplier Part Number 1: 541-47KJCT-ND; Technology: Thick Film; ComponentLink1URL: http://www.vishay.com/docs/20035/dcrcwe3.pdf
R98 = CMP-0025663-3: RES, 97.6 k, 0.5%, 0.1 W, 0603; Manufacturer: Yageo America; Value: 97.6k; Value_Code: 97k6; Power_W: 100mW; Value2: 0.1W; VDC_V: 75V; TempCo: 50 ppm/C; EIA_Code: E192; U/M: EA; AEC Category: Q200; SizeY_mm: 0.8; SizeZ_mm: 1; SizeArea_mm2: 1.28; SizeX_mm: 1.6; CompType: Resistor; PartNumber: RT0603DRE0797K6L; PackageReference: 0603; RoHS: Y; Res_ohm: 97.6k; Tolerance_%: 0.5%; Value1: 0.5%; MountType: SMT; Technology: Thin Film; Published: 2008-06-26; Publisher: Texas Instruments; LatestRevisionDate: 2017-03-09; ComponentLink1Description: Datasheet link; ComponentLink1URL: http://www.yageo.com/pdf/PYu-RT_1-to-0.05_RoHS_L_3.pdf; AEC Qualified: ?
R99-R103 R105-R109 = CMP-0025886-5: RES, 10 k, 5%, 0.1 W, 0603; Manufacturer: Yageo; Power_W: 100mW; TempCo: 100 ppm/C; Value_Code: 10k0; Value: 10k; EIA_Code: E24; SizeX_mm: 1.6; SizeY_mm: 0.8; SizeZ_mm: 1; Value2: 0.1W; SizeArea_mm2: 1.28; AEC Qualified: N; VDC_V: 75V; AEC Category: Q200; SizeAreaWB_mm2: 4.68; Supplier Part Number 2: 603-RC0603JR-0710KL; Supplier 2: Mouser; Supplier Part Number 3: 9233504; Supplier 3: Farnell; RoHS: Y; Value1: 5%; MountType: SMT; Supplier 1: Digi-Key; PackageReference: 0603; Tolerance_%: 5%; Res_ohm: 10k; CompType: Resistor; PartNumber: RC0603JR-0710KL; ComponentLink1Description: Datasheet link; Supplier Part Number 1: 311-10KGRCT-ND; Technology: Thick Film; ComponentLink1URL: http://www.yageo.com/pdf/Pu-RC0603_51_PbFree_L_2.pdf; AEC Grade: N/A
R110 = CMP-0023183-5: RES, 560, 1%, 0.1 W, 0603; Manufacturer: Yageo; Power_W: 100mW; TempCo: 100 ppm/C; Value_Code: 560R; Value: 560; SizeX_mm: 1.6; SizeY_mm: 0.8; SizeZ_mm: 1; Value2: 0.1W; SizeArea_mm2: 1.28; AEC Qualified: N; VDC_V: 75V; AEC Category: Q200; SizeAreaWB_mm2: 4.68; Supplier Part Number 2: 603-RC0603FR-07560RL; Supplier 2: Mouser; Supplier Part Number 3: 9238450; Supplier 3: Farnell; RoHS: Y; Value1: 1%; MountType: SMT; Supplier 1: Digi-Key; PackageReference: 0603; Tolerance_%: 1%; Res_ohm: 560; CompType: Resistor; PartNumber: RC0603FR-07560RL; ComponentLink1Description: Datasheet link; Supplier Part Number 1: 311-560HRCT-ND; Technology: Thick Film; ComponentLink1URL: http://www.yageo.com/pdf/Pu-RC0603_51_PbFree_L_2.pdf; AEC Grade: N/A
R111-R117 = CMP-0025785-4: RES, 330, 5%, 0.1 W, AEC-Q200 Grade 0, 0603; PartNumber: CRCW0603330RJNEA; Manufacturer: Vishay-Dale; CompType: Resistor; Value: 330; Value_Code: 330R; Power_W: 100mW; Value2: 0.1W; VDC_V: 75V; TempCo: 200 ppm/C; EIA_Code: E24; AEC Category: Q200; AEC Qualified: Y; AEC Grade: 0; SizeX_mm: 1.6; SizeY_mm: 0.8; SizeZ_mm: 1; SizeArea_mm2: 1.28; PackageReference: 0603; RoHS: E; Res_ohm: 330; Tolerance_%: 5%; Value1: 5%; MountType: SMT; Technology: Thick Film; ComponentLink1Description: Datasheet link; ComponentLink1URL: http://www.vishay.com/docs/20035/dcrcwe3.pdf; Supplier 1: Digi-Key; Supplier Part Number 1: 541-330GCT-ND; Supplier 2: Newark; Supplier Part Number 2: 59M6805; Supplier 3: Mouser; Supplier Part Number 3: 71-CRCW0603J-330-E3
R118 = CMP-0023129-5: RES, 470, 1%, 0.1 W, 0603; Manufacturer: Yageo; Power_W: 100mW; TempCo: 100 ppm/C; Value_Code: 470R; Value: 470; SizeX_mm: 1.6; SizeY_mm: 0.8; SizeZ_mm: 1; Value2: 0.1W; SizeArea_mm2: 1.28; AEC Qualified: N; VDC_V: 75V; AEC Category: Q200; SizeAreaWB_mm2: 4.68; Supplier Part Number 2: 603-RC0603FR-07470RL; Supplier 2: Mouser; Supplier Part Number 3: 9238441; Supplier 3: Farnell; RoHS: Y; Value1: 1%; MountType: SMT; Supplier 1: Digi-Key; PackageReference: 0603; Tolerance_%: 1%; Res_ohm: 470; CompType: Resistor; PartNumber: RC0603FR-07470RL; ComponentLink1Description: Datasheet link; Supplier Part Number 1: 311-470HRCT-ND; Technology: Thick Film; ComponentLink1URL: http://www.yageo.com/pdf/Pu-RC0603_51_PbFree_L_2.pdf; AEC Grade: N/A
S1 = CMP-0097347-1: Tactile Switch SPST-NO Top Actuated Surface Mount; Manufacturer: Wurth Electronics; VDC_V: 12V; Electromechanical Life: 1000000Cycles; SizeZ_mm: 2.7mm; Coil Resistance_ohm: 100mΩ; Operating Force: 160gf; AEC Qualified: No; Contact Current Rating: 50mA; ComponentLink1Description: Datasheet; Digikey Description: SWITCH TACTILE SPST-NO 0.05A 12V; ComponentLink1URL: https://www.we-online.com/catalog/datasheet/430481025816.pdf; RoHS: TRUE; MountType: Surface Mount; PackageReference: SMT_SW_6MM2_6MM2; Mouser Part Number: 710-430481025816; Lead Free: Yes; Circuit: SPST-NO; PartNumber: 430481025816; Operating Temperature Range: -40°C to +85°C; Digikey Part Number: 732-7022-1-ND; Supplier 2: Mouser; helpURL: https://upverter.com/upn/revision/d8864f3c5ff6f52e/; Datasheet Path: datasheets/Switch-430481025816.pdf; Mouser Description: Switch Tactile Spst-no 0.05A 12V; Part Number: 430481025816; datasheet: https://www.we-online.com/catalog/datasheet/430481025816.pdf; Supplier 1: Digikey; Supplier Part Number 1: 732-7022-1-ND; Supplier Part Number 2: 710-430481025816
SH-J18-SH-J22 = CMP-0003761-2: as SH-J23 on sheet MD040_ezFET_RevA; ComponentLink1URL: http://katalog.we-online.de/em/datasheet/60900213421.pdf; Supplier Part Number 2: 16T0609; Supplier 3: Mouser; Supplier 1: Digi-Key; CompType: Shunt; PackageReference: Shunt, 2.54mm, Black; RoHS: Y; Supplier Part Number 1: 732-2678-ND; Supplier Part Number 3: 710-60900213421; Supplier 2: Newark; MountType: N/A; PartNumber: 60900213421; ComponentLink1Description: Datasheet Link; ClassName: Shunt
TP28 TP30 TP36 = CMP-0055147-1: Test Point, Multipurpose, Red, TH; Manufacturer: Keystone; CNHeader: FALSE; Green_Lifecycle: Active; Green_REACh: Passed; ContactFinish: Silver; CT: TRUE; ComponentLink1URL: http://www.keyelco.com/userAssets/file/M60-2p60.pdf; Supplier Part Number 2: 534-5010; Publisher: Texas Instruments; Supplier 2: Mouser; Color: Red; RoHS: Y; MountType: TH; Green_EU RoHS-2: Incomplete; Supplier 1: Digi-Key; Green_EU RoHS: Passed; PackageReference: Red Multipurpose Testpoint; CompType: Test Point; LatestRevisionDate: 26/05/2017; PartNumber: 5010; ComponentLink1Description: Datasheet URL; Supplier Part Number 1: 36-5010-ND
TP29 = CMP-0055148-1: Test Point, Multipurpose, Black, TH; Manufacturer: Keystone; CNHeader: FALSE; Green_Lifecycle: Active; Green_REACh: Passed; ContactFinish: Silver; CT: TRUE; ComponentLink1URL: http://www.keyelco.com/userAssets/file/M60-2p60.pdf; Supplier Part Number 2: 534-5011; Publisher: Texas Instruments; Supplier 2: Mouser; Color: Black; RoHS: Y; MountType: TH; Green_EU RoHS-2: Incomplete; Supplier 1: Digi-Key; Green_EU RoHS: Passed; PackageReference: Black Multipurpose Testpoint; CompType: Test Point; LatestRevisionDate: 26/05/2017; PartNumber: 5011; ComponentLink1Description: Datasheet URL; Supplier Part Number 1: 36-5011-ND
TP31 TP32 TP34 TP35 = CMP-0055152-1: Test Point, Miniature, SMT; Manufacturer: Keystone; CNHeader: FALSE; Green_Lifecycle: Active; Green_REACh: Passed; CT: TRUE; ComponentLink1URL: http://www.keyelco.com/userAssets/store/files/5015.PDF; Supplier Part Number 2: 534-5015; Publisher: Texas Instruments; Supplier 2: Mouser; RoHS: Y; MountType: SMT; Green_EU RoHS-2: Incomplete; Supplier 1: Digi-Key; Green_EU RoHS: Passed; PackageReference: Testpoint_Keystone_Miniature; CompType: Test Point; LatestRevisionDate: 26/05/2017; PartNumber: 5015; ComponentLink1Description: Datasheet URL; Supplier Part Number 1: 36-5015TR-ND
U7 = CMP-0094066-1: Stepper Motor Driver with Automatic Microstepping, Silent step Decay Mode and Auto-torque; Manufacturer: Texas Instruments; TJmax_C: +150°C; TaMin_C: -40°C; Standoff Height: 0.05mm; Number Of Outputs: 1; Nominal Supply Current: 3-7mA; AEC Qualified: No; Max Supply Voltage: 60V; Min Supply Voltage: 4.5V; TaMax_C: +125°C; Switching Frequency: 500kHz; SizeZ_mm: 1.2mm; Motor Type: Stepper; Datasheet Path: datasheets/IC-DRV8462DDWR.pdf; PackageReference: HTSSOP44; RoHS: UNKNOWN; PartNumber: DRV8462DDWR; Part Number: DRV8462DDWR; helpURL: https://upverter.com/upn/revision/188eb21097f53541/; Operating Temperature Range: -40°C to +150°C